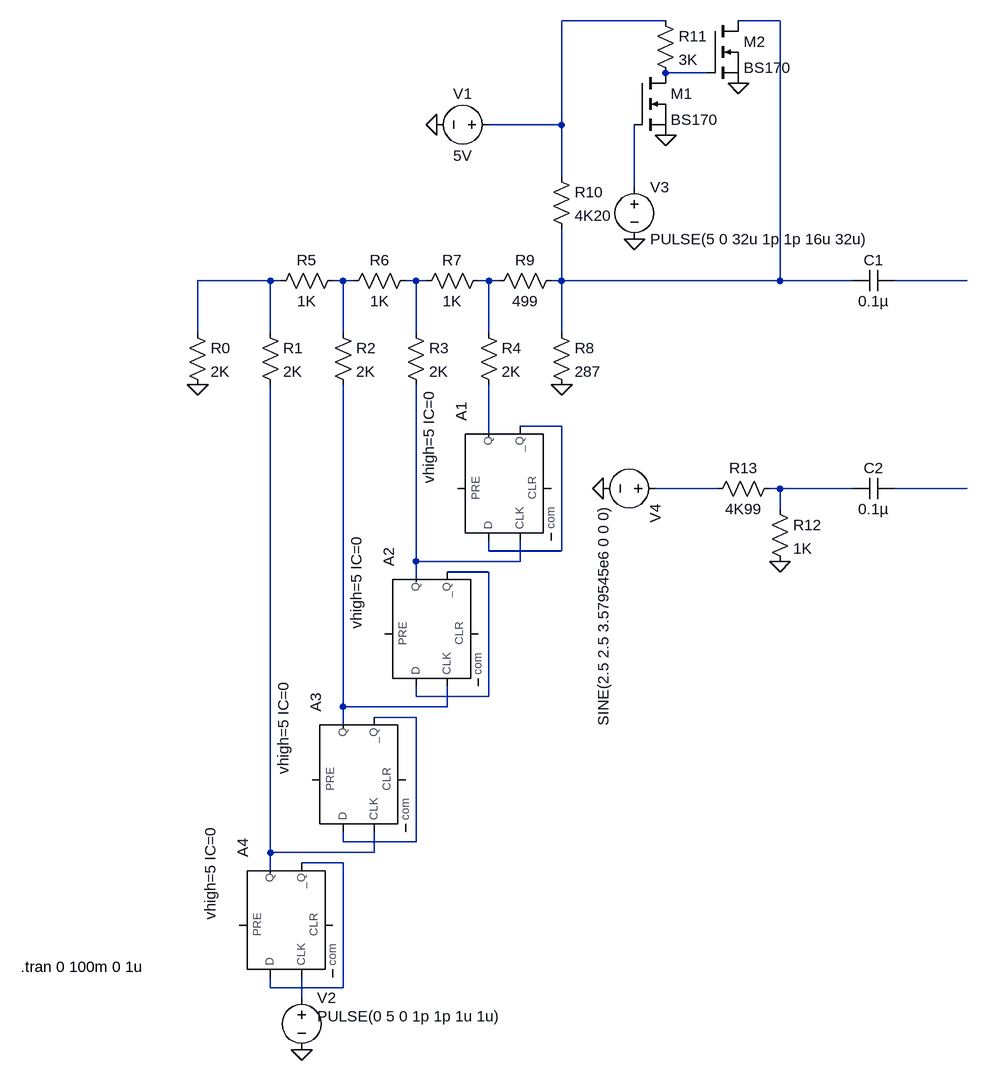
[diagram p0: schematic sbc-video-spice.asc]
sbc-video-spice.asc, the LTspice schematic file:
Version 4.1
SHEET 1 1924 2040
WIRE 608 -320 448 -320
WIRE 784 -320 720 -320
WIRE 672 -240 608 -240
WIRE 448 -160 448 -320
WIRE 448 -160 336 -160
WIRE 448 -80 448 -160
WIRE 560 -64 560 -160
WIRE 0 80 -112 80
WIRE 16 80 0 80
WIRE 112 80 96 80
WIRE 128 80 112 80
WIRE 224 80 208 80
WIRE 240 80 224 80
WIRE 336 80 320 80
WIRE 352 80 336 80
WIRE 448 80 448 0
WIRE 448 80 432 80
WIRE 784 80 784 -320
WIRE 784 80 448 80
WIRE 896 80 784 80
WIRE 1072 80 960 80
WIRE -112 160 -112 80
WIRE 0 160 0 80
WIRE 112 160 112 80
WIRE 224 160 224 80
WIRE 336 160 336 80
WIRE 448 160 448 80
WIRE 448 304 384 304
WIRE 336 320 336 240
WIRE 688 400 592 400
WIRE 784 400 768 400
WIRE 896 400 784 400
WIRE 1072 400 960 400
WIRE 784 432 784 400
WIRE 336 496 336 480
WIRE 448 496 448 304
WIRE 448 496 336 496
WIRE 224 512 224 240
WIRE 384 512 384 480
WIRE 384 512 224 512
WIRE 336 528 272 528
WIRE 224 544 224 512
WIRE 224 720 224 704
WIRE 336 720 336 528
WIRE 336 720 224 720
WIRE 112 736 112 240
WIRE 272 736 272 704
WIRE 272 736 112 736
WIRE 224 752 160 752
WIRE 112 768 112 736
WIRE 112 944 112 928
WIRE 224 944 224 752
WIRE 224 944 112 944
WIRE 0 960 0 240
WIRE 160 960 160 928
WIRE 160 960 0 960
WIRE 112 976 48 976
WIRE 0 992 0 960
WIRE 0 1168 0 1152
WIRE 112 1168 112 976
WIRE 112 1168 0 1168
WIRE 48 1184 48 1152
FLAG 48 1264 0
FLAG -112 240 0
FLAG 256 -160 0
FLAG 448 240 0
FLAG 608 -144 0
FLAG 720 -224 0
FLAG 560 16 0
FLAG 512 400 0
FLAG 784 512 0
SYMBOL res -16 144 R0
SYMATTR InstName R1
SYMATTR Value 2K
SYMBOL res 96 144 R0
SYMATTR InstName R2
SYMATTR Value 2K
SYMBOL res 208 144 R0
SYMATTR InstName R3
SYMATTR Value 2K
SYMBOL res 320 144 R0
SYMATTR InstName R4
SYMATTR Value 2K
SYMBOL res -128 144 R0
SYMATTR InstName R0
SYMATTR Value 2K
SYMBOL res 112 64 R90
WINDOW 0 0 56 VBottom 2
WINDOW 3 32 56 VTop 2
SYMATTR InstName R5
SYMATTR Value 1K
SYMBOL res 224 64 R90
WINDOW 0 0 56 VBottom 2
WINDOW 3 32 56 VTop 2
SYMATTR InstName R6
SYMATTR Value 1K
SYMBOL res 336 64 R90
WINDOW 0 0 56 VBottom 2
WINDOW 3 32 56 VTop 2
SYMATTR InstName R7
SYMATTR Value 1K
SYMBOL Digital\\dflop 288 400 R270
WINDOW 3 8 -44 Left 2
SYMATTR Value vhigh=5 IC=0
SYMATTR InstName A1
SYMBOL voltage 48 1168 R0
WINDOW 3 24 44 Left 2
WINDOW 123 0 0 Left 0
WINDOW 39 0 0 Left 0
SYMATTR Value PULSE(0 5 0 1p 1p 1u 1u)
SYMATTR InstName V2
SYMBOL Digital\\dflop 176 624 R270
WINDOW 3 8 -44 Left 2
SYMATTR Value vhigh=5 IC=0
SYMATTR InstName A2
SYMBOL Digital\\dflop 64 848 R270
WINDOW 3 8 -44 Left 2
SYMATTR Value vhigh=5 IC=0
SYMATTR InstName A3
SYMBOL Digital\\dflop -48 1072 R270
WINDOW 3 8 -44 Left 2
SYMATTR Value vhigh=5 IC=0
SYMATTR InstName A4
SYMBOL res 432 144 R0
SYMATTR InstName R8
SYMATTR Value 287
SYMBOL voltage 352 -160 R90
WINDOW 0 -32 56 VBottom 2
WINDOW 3 32 56 VTop 2
WINDOW 123 0 0 Left 0
WINDOW 39 0 0 Left 0
SYMATTR InstName V1
SYMATTR Value 5V
SYMBOL res 448 64 R90
WINDOW 0 0 56 VBottom 2
WINDOW 3 32 56 VTop 2
SYMATTR InstName R9
SYMATTR Value 499
SYMBOL res 432 -96 R0
SYMATTR InstName R10
SYMATTR Value 4K20
SYMBOL nmos 560 -240 R0
SYMATTR InstName M1
SYMATTR Value BS170
SYMBOL nmos 672 -320 R0
SYMATTR InstName M2
SYMATTR Value BS170
SYMBOL res 592 -336 R0
SYMATTR InstName R11
SYMATTR Value 3K
SYMBOL voltage 560 -80 R0
WINDOW 123 0 0 Left 0
WINDOW 39 0 0 Left 0
SYMATTR InstName V3
SYMATTR Value PULSE(5 0 32u 1p 1p 16u 32u)
SYMBOL cap 960 64 R90
WINDOW 0 0 32 VBottom 2
WINDOW 3 32 32 VTop 2
SYMATTR InstName C1
SYMATTR Value 0.1µ
SYMATTR SpiceLine V=16 Irms=728m Rser=0.14361 Lser=0 mfg="KEMET" pn="C0603C104K4RAC" type="X7R"
SYMBOL voltage 608 400 R90
WINDOW 123 0 0 Left 0
WINDOW 39 0 0 Left 0
SYMATTR InstName V4
SYMATTR Value SINE(2.5 2.5 3.579545e6 0 0 0)
SYMBOL res 768 416 R0
SYMATTR InstName R12
SYMATTR Value 1K
SYMBOL res 784 384 R90
WINDOW 0 0 56 VBottom 2
WINDOW 3 32 56 VTop 2
SYMATTR InstName R13
SYMATTR Value 4K99
SYMBOL cap 960 384 R90
WINDOW 0 0 32 VBottom 2
WINDOW 3 32 32 VTop 2
SYMATTR InstName C2
SYMATTR Value 0.1µ
SYMATTR SpiceLine V=500 Irms=867m Rser=0.0254657 Lser=0 mfg="KEMET" pn="C1812C104KCRAC" type="X7R"
TEXT -384 1136 Left 2 !.tran 0 100m 0 1u

The netlist it stands for:
* sbc-video-spice.asc
R1 N005 N019 2K
R2 N006 N017 2K
R3 N007 N015 2K
R4 N008 N011 2K
R0 N005 0 2K
R5 N006 N005 1K
R6 N007 N006 1K
R7 N008 N007 1K
A1 N010 0 N015 0 0 N010 N011 0 DFLOP vhigh=5 IC=0
V2 N021 0 PULSE(0 5 0 1p 1p 1u 1u)
A2 N016 0 N017 0 0 N016 N015 0 DFLOP vhigh=5 IC=0
A3 N018 0 N019 0 0 N018 N017 0 DFLOP vhigh=5 IC=0
A4 N020 0 N021 0 0 N020 N019 0 DFLOP vhigh=5 IC=0
R8 N002 0 287
V1 N001 0 5V
R9 N002 N008 499
R10 N001 N002 4K20
M1 N003 N004 0 0 BS170
M2 N002 N003 0 0 BS170
R11 N001 N003 3K
V3 N004 0 PULSE(5 0 32u 1p 1p 16u 32u)
C1 N009 N002 0.1µ V=16 Irms=728m Rser=0.14361 Lser=0 mfg="KEMET" pn="C0603C104K4RAC" type="X7R"
V4 N012 0 SINE(2.5 2.5 3.579545e6 0 0 0)
R12 N013 0 1K
R13 N013 N012 4K99
C2 N014 N013 0.1µ V=500 Irms=867m Rser=0.0254657 Lser=0 mfg="KEMET" pn="C1812C104KCRAC" type="X7R"
.model NMOS NMOS
.model PMOS PMOS
.lib standard.mos
.tran 0 100m 0 1u
.backanno
.end